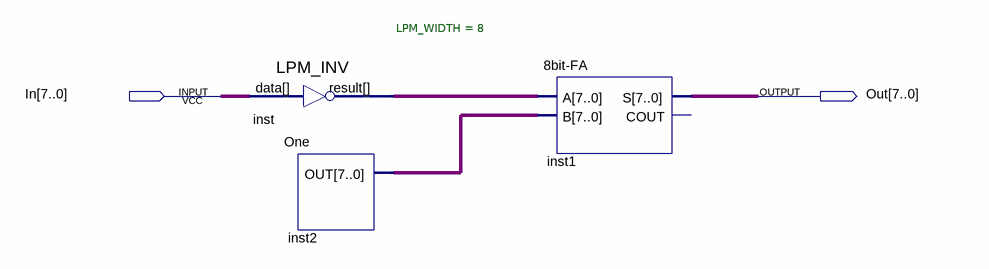
[diagram p0: schematic sheet]
// Quartus schematic 2sComplement.bdf as structural Verilog: 3 symbols, 2 pins
module \2sComplement  (
  input  [7:0] In,
  output [7:0] Out
);

  wire [7:0] inst2_out, inst_result;

  LPM_INV #(.LPM_WIDTH(8)) inst (.data(In), .result(inst_result));
  One inst2 (.OUT(inst2_out));
  \8bit-FA  inst1 (.A(inst_result), .B(inst2_out), .S(Out));  // open: COUT
endmodule
